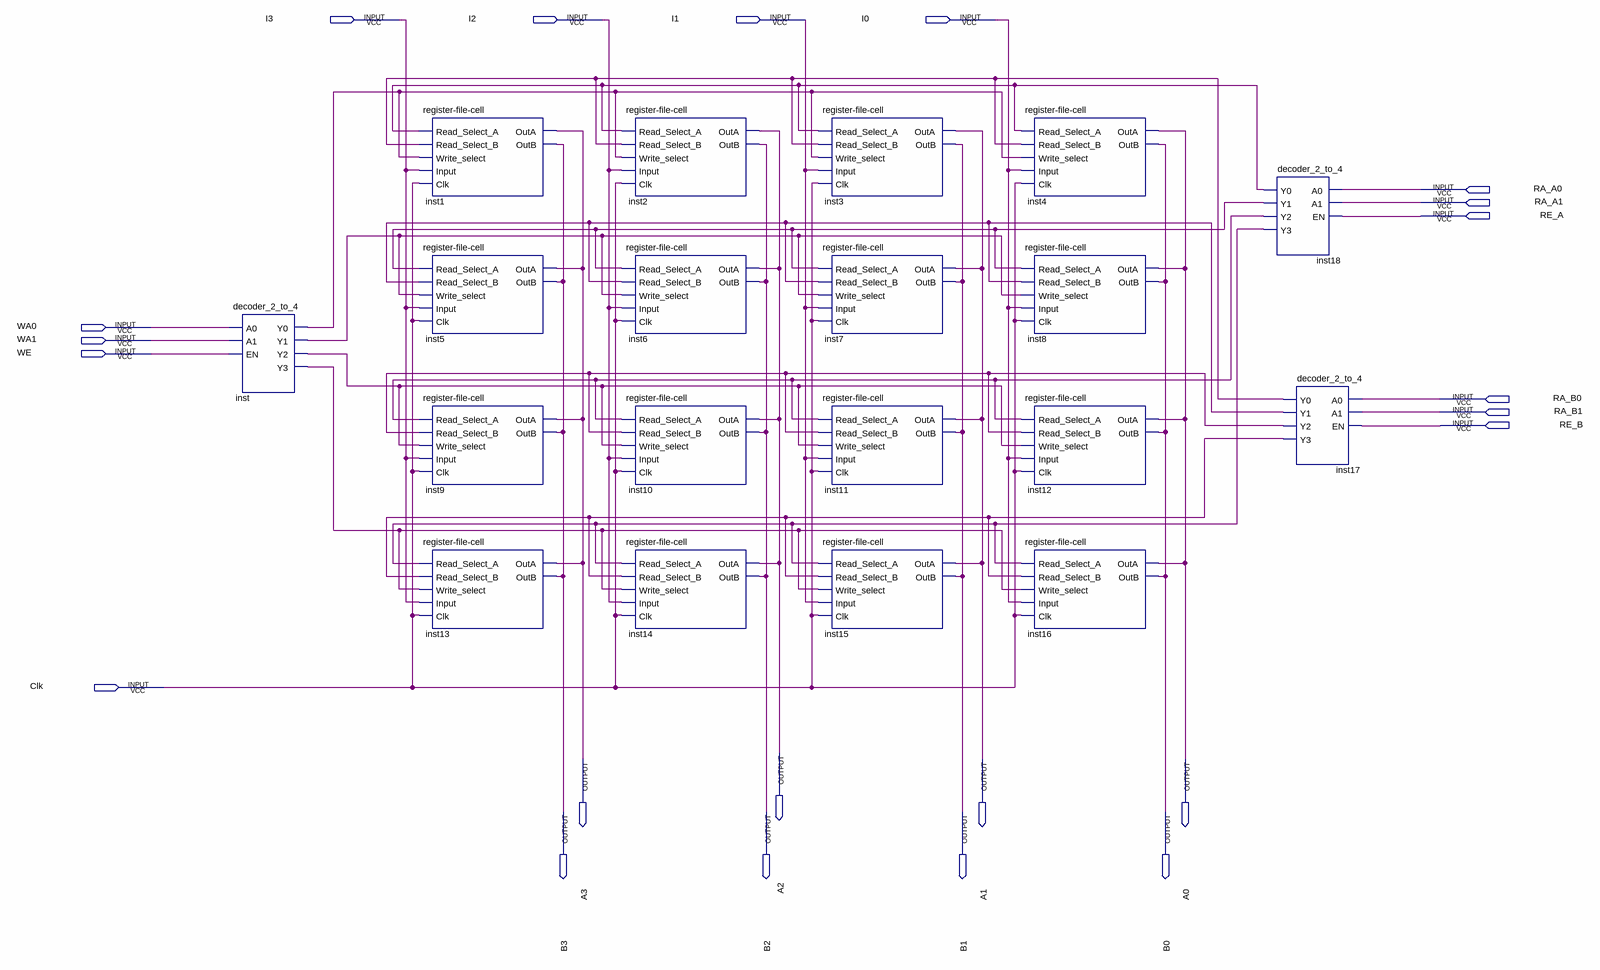
[diagram p0: schematic sheet]
// Quartus schematic resgister_2_read.bdf as structural Verilog: 19 symbols, 22 pins
module resgister_2_read (
  input  I3,
  input  I2,
  input  I1,
  input  I0,
  input  RA_A0,
  input  RA_A1,
  input  RE_A,
  input  WA0,
  input  WA1,
  input  WE,
  input  RA_B0,
  input  RA_B1,
  input  RE_B,
  input  Clk,
  output A2,
  output A3,
  output A1,
  output A0,
  output B3,
  output B2,
  output B1,
  output B0
);

  wire inst17_y0, inst17_y1, inst17_y2, inst17_y3, inst18_y0, inst18_y1, inst18_y2, inst18_y3, inst_y0,
       inst_y1, inst_y2, inst_y3;

  decoder_2_to_4 inst (.A0(WA0), .A1(WA1), .EN(WE), .Y0(inst_y0), .Y1(inst_y1), .Y2(inst_y2), .Y3(inst_y3));
  \register-file-cell  inst1 (
    .Read_Select_A(inst18_y0), .Read_Select_B(inst17_y0), .Write_select(inst_y0), .Input(I3), .Clk(Clk),
    .OutA(A3), .OutB(B3));
  \register-file-cell  inst5 (
    .Read_Select_A(inst18_y1), .Read_Select_B(inst17_y1), .Write_select(inst_y1), .Input(I3), .Clk(Clk),
    .OutA(A3), .OutB(B3));
  \register-file-cell  inst9 (
    .Read_Select_A(inst18_y2), .Read_Select_B(inst17_y2), .Write_select(inst_y2), .Input(I3), .Clk(Clk),
    .OutA(A3), .OutB(B3));
  \register-file-cell  inst13 (
    .Read_Select_A(inst18_y3), .Read_Select_B(inst17_y3), .Write_select(inst_y3), .Input(I3), .Clk(Clk),
    .OutA(A3), .OutB(B3));
  \register-file-cell  inst2 (
    .Read_Select_A(inst18_y0), .Read_Select_B(inst17_y0), .Write_select(inst_y0), .Input(I2), .Clk(Clk),
    .OutA(A2), .OutB(B2));
  \register-file-cell  inst6 (
    .Read_Select_A(inst18_y1), .Read_Select_B(inst17_y1), .Write_select(inst_y1), .Input(I2), .Clk(Clk),
    .OutA(A2), .OutB(B2));
  \register-file-cell  inst10 (
    .Read_Select_A(inst18_y2), .Read_Select_B(inst17_y2), .Write_select(inst_y2), .Input(I2), .Clk(Clk),
    .OutA(A2), .OutB(B2));
  \register-file-cell  inst14 (
    .Read_Select_A(inst18_y3), .Read_Select_B(inst17_y3), .Write_select(inst_y3), .Input(I2), .Clk(Clk),
    .OutA(A2), .OutB(B2));
  \register-file-cell  inst3 (
    .Read_Select_A(inst18_y0), .Read_Select_B(inst17_y0), .Write_select(inst_y0), .Input(I1), .Clk(Clk),
    .OutA(A1), .OutB(B1));
  \register-file-cell  inst7 (
    .Read_Select_A(inst18_y1), .Read_Select_B(inst17_y1), .Write_select(inst_y1), .Input(I1), .Clk(Clk),
    .OutA(A1), .OutB(B1));
  \register-file-cell  inst11 (
    .Read_Select_A(inst18_y2), .Read_Select_B(inst17_y2), .Write_select(inst_y2), .Input(I1), .Clk(Clk),
    .OutA(A1), .OutB(B1));
  \register-file-cell  inst15 (
    .Read_Select_A(inst18_y3), .Read_Select_B(inst17_y3), .Write_select(inst_y3), .Input(I1), .Clk(Clk),
    .OutA(A1), .OutB(B1));
  \register-file-cell  inst4 (
    .Read_Select_A(inst18_y0), .Read_Select_B(inst17_y0), .Write_select(inst_y0), .Input(I0), .Clk(Clk),
    .OutA(A0), .OutB(B0));
  \register-file-cell  inst8 (
    .Read_Select_A(inst18_y1), .Read_Select_B(inst17_y1), .Write_select(inst_y1), .Input(I0), .Clk(Clk),
    .OutA(A0), .OutB(B0));
  \register-file-cell  inst12 (
    .Read_Select_A(inst18_y2), .Read_Select_B(inst17_y2), .Write_select(inst_y2), .Input(I0), .Clk(Clk),
    .OutA(A0), .OutB(B0));
  \register-file-cell  inst16 (
    .Read_Select_A(inst18_y3), .Read_Select_B(inst17_y3), .Write_select(inst_y3), .Input(I0), .Clk(Clk),
    .OutA(A0), .OutB(B0));
  decoder_2_to_4 inst18 (
    .A0(RA_A0), .A1(RA_A1), .EN(RE_A), .Y0(inst18_y0), .Y1(inst18_y1), .Y2(inst18_y2), .Y3(inst18_y3));
  decoder_2_to_4 inst17 (
    .A0(RA_B0), .A1(RA_B1), .EN(RE_B), .Y0(inst17_y0), .Y1(inst17_y1), .Y2(inst17_y2), .Y3(inst17_y3));
endmodule
